# Altium schematic sheet HALL_CURRENT_SENSE_LEM_55P.SchDoc
size A4; Organization: Altium Limited; Address1: L3, 12a Rodborough Rd; Address2: Frenchs Forest; Address3: NSW; Address4: Australia 2086
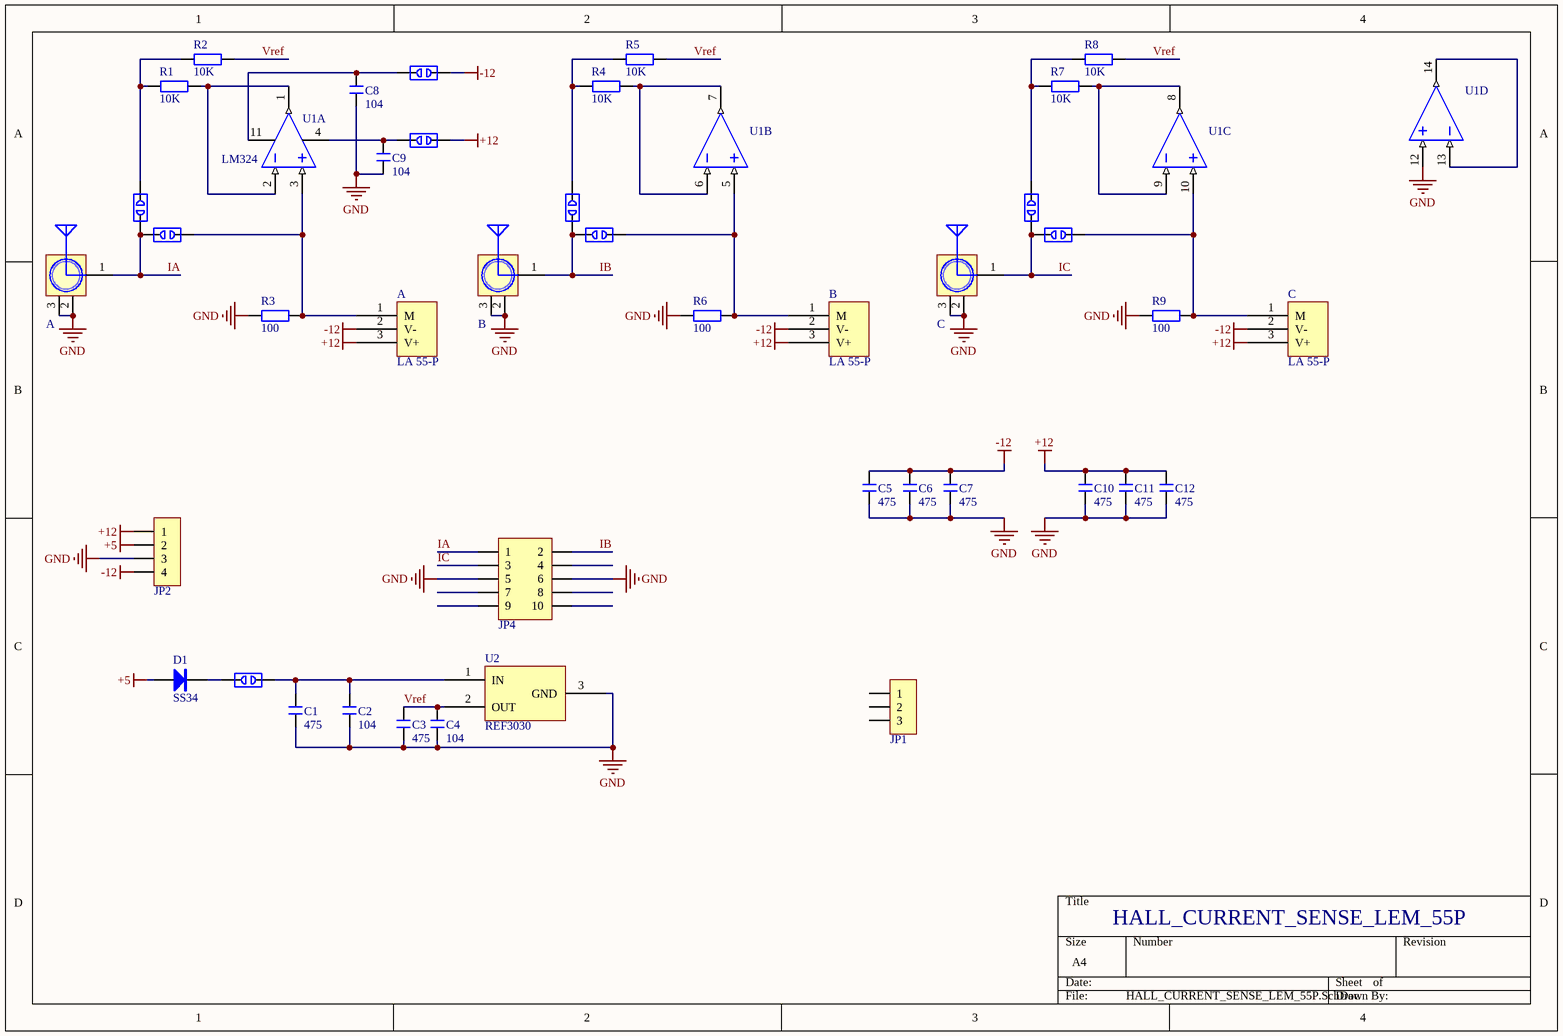
[diagram p0: HALL_CURRENT_SENSE_LEM_55P.SchDoc]

## Parts
(Parts that share a designator on the sheet are numbered #1, #2 ... from top to bottom, then left to right.)
A#1  SMA WIFI 天线接口  [SMA-KE-LI]  (value not drawn)
A#2  LA 55-P  [LA 55-P]
B#1  SMA WIFI 天线接口  [SMA-KE-LI]  (value not drawn)
B#2  LA 55-P  [LA 55-P]
C1  475  [C 0805_L]
C2  104  [C 0805_L]
C3  475  [C 0805_L]
C4  104  [C 0805_L]
C5  475  [C 0805_L]
C6  475  [C 0805_L]
C7  475  [C 0805_L]
C8  104  [C 0805_L]
C9  104  [C 0805_L]
C10  475  [C 0805_L]
C11  475  [C 0805_L]
C12  475  [C 0805_L]
C#1  SMA WIFI 天线接口  [SMA-KE-LI]  (value not drawn)
C#2  LA 55-P  [LA 55-P]
D1  SS34  [SMA]
DE1  DEBUG PAD  [DEBUG_B]  (value not drawn)
DE2  DEBUG PAD  [DEBUG_B]  (value not drawn)
DE3  DEBUG PAD  [DEBUG_B]  (value not drawn)
DE4  DEBUG PAD  [DEBUG_B]  (value not drawn)
DE5  DEBUG PAD  [DEBUG_B]  (value not drawn)
DE6  DEBUG PAD  [DEBUG_B]  (value not drawn)
DE7  DEBUG PAD  [DEBUG_B]  (value not drawn)
DE8  DEBUG PAD  [DEBUG_B]  (value not drawn)
DE9  DEBUG PAD  [DEBUG_B]  (value not drawn)
JP1  HDR-1X3  [KF7620-3P]  (value not drawn)
JP2  HDR-1X4  [KF2510-LI-4P]  (value not drawn)
JP4  Header 5X2  [IDC2.54-LI-2x5P]  (value not drawn)
R1  10K  [R 0805_L]
R2  10K  [R 0805_L]
R3  100  [R 2512_M]
R4  10K  [R 0805_L]
R5  10K  [R 0805_L]
R6  100  [R 2512_M]
R7  10K  [R 0805_L]
R8  10K  [R 0805_L]
R9  100  [R 2512_M]
U1  LM324  [SOIC-14]  (parts A,B,C,D of 4)
U2  REF3030  [SOT23-3L]

## Nets
+5: D1.1(A) JP2.2
+12: A#2.3(V+) B#2.3(V+) C10.2 C11.2 C12.2 C#2.3(V+) DE9.1 JP2.1
-12: A#2.2(V-) B#2.2(V-) C5.2 C6.2 C7.2 C#2.2(V-) DE8.1 JP2.4
GND: A#1.2(GND) A#1.3(GND) B#1.2(GND) B#1.3(GND) C1.1 C2.1 C3.1 C4.1 C5.1 C6.1 C7.1 C8.1 C9.1 C10.1 C11.1 C12.1 C#1.2(GND) C#1.3(GND) JP2.3 JP4.5 JP4.6 R3.2 R6.2 R9.2 U1.12(IN+) U2.3(GND)
IA: A#1.1(ANT) DE1.1 DE2.2 JP4.1
IB: B#1.1(ANT) DE4.1 DE5.2 JP4.2
IC: C#1.1(ANT) DE6.1 DE7.2 JP4.3
Vref: C3.2 C4.2 R2.1 R5.1 R8.1 U2.2(OUT)
NetA#2_1: A#2.1(M) DE2.1 R3.1 U1.3(IN+)
NetB#2_1: B#2.1(M) DE5.1 R6.1 U1.5(IN+)
NetC1_2: C1.2 C2.2 DE3.2 U2.1(IN)
NetC8_2: C8.2 DE8.2 U1.11(V-)
NetC9_2: C9.2 DE9.2 U1.4(V+)
NetC#2_1: C#2.1(M) DE7.1 R9.1 U1.10(IN+)
NetD1_2: D1.2(K) DE3.1
NetDE1_2: DE1.2 R1.1 R2.2
NetDE4_2: DE4.2 R4.1 R5.2
NetDE6_2: DE6.2 R7.1 R8.2
NetR1_2: R1.2 U1.1(OUT) U1.2(IN-)
NetR4_2: R4.2 U1.6(IN-) U1.7(OUT)
NetR7_2: R7.2 U1.8(OUT) U1.9(IN-)
NetU1_13: U1.13(IN-) U1.14(OUT)

Not connected (* = marked no-connect by the designer): JP1 1 2 3; JP4 4 7 8 9 10

## Notes on the sheet
- HALL_CURRENT_SENSE_LEM_55P <v>
- Title
- Size:
- Date:
- A4
- Number:
- Time:
- Revision:
- Sheet
- of
- File:

## Library data of the parts
A#1 B#1 C#1 = SMA WIFI: SMA-2.4G射频天线接口; 淘宝ID: 小糖豆的小窝窝; BOM名称: SMA-2.4G射频天线接口; 下单链接: https://item.taobao.com/item.htm?ft=t&id=613637044352
A#2 B#2 C#2 = LA 55-P: LEM 莱姆闭环霍尔电流传感器
C1-C12 = C: 贴片电容; 淘宝ID: 小糖豆的小窝窝; BOM名称: 贴片电容; 下单链接: https://item.taobao.com/item.htm?ft=t&id=613637044352
D1 = 1N4007: 整流二极管; 淘宝ID: 小糖豆的小窝窝; BOM名称: 整流二极管; 下单链接: https://item.taobao.com/item.htm?ft=t&id=613637044352
DE1-DE9 = DEBUG: 调试断点焊盘; 淘宝ID: 小糖豆的小窝窝; BOM名称: 调试断点焊盘; 下单链接: https://item.taobao.com/item.htm?ft=t&id=613637044352
JP1 = Header 3: 3P接插件; 淘宝ID: 小糖豆的小窝窝; BOM名称: 3P接插件; 下单链接: https://item.taobao.com/item.htm?ft=t&id=613637044352
JP2 = Header 4: 4P接插件; 淘宝ID: 小糖豆的小窝窝; BOM名称: 4P接插件; 下单链接: https://item.taobao.com/item.htm?ft=t&id=613637044352
JP4 = Header 5X2: 5*2P接插件; 淘宝ID: 小糖豆的小窝窝; BOM名称: 5*2P接插件; 下单链接: https://item.taobao.com/item.htm?ft=t&id=613637044352
R1-R9 = R: 贴片电阻; 淘宝ID: 小糖豆的小窝窝; BOM名称: 贴片电阻; 下单链接: https://item.taobao.com/item.htm?ft=t&id=613637044352
U1 = LM324: 4路运放; 淘宝ID: 小糖豆的小窝窝; Alias1: https://item.taobao.com/item.htm?ft=t&id=613637044352; BOM名称: 4路运放